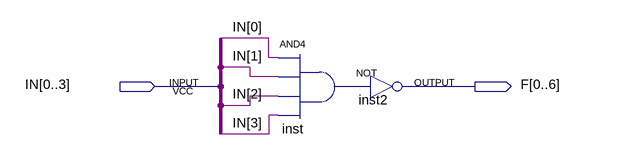
[diagram p0: schematic sheet]
// Quartus schematic block_HEX.bdf as structural Verilog: 2 symbols, 2 pins
module block_HEX (
  input  [0:3] IN,
  output [0:6] F
);

  wire inst_out;

  and inst (inst_out, IN[0], IN[1], IN[2], IN[3]);
  assign F = ~{7{inst_out}};  // NOT inst2, 7 bits wide
endmodule
